# EasyEDA Pro project Orion SR SCH.epro

# Schematic Schematic1
Board Name: Board1; Create Date: 2026-11-20; Page Name: P1; Project Name: Orion G07(4); Schematic Name: Schematic1; Update Date: 2026-11-20; Company: EasyEDA.com; Page Size: A4; Version: V1.0
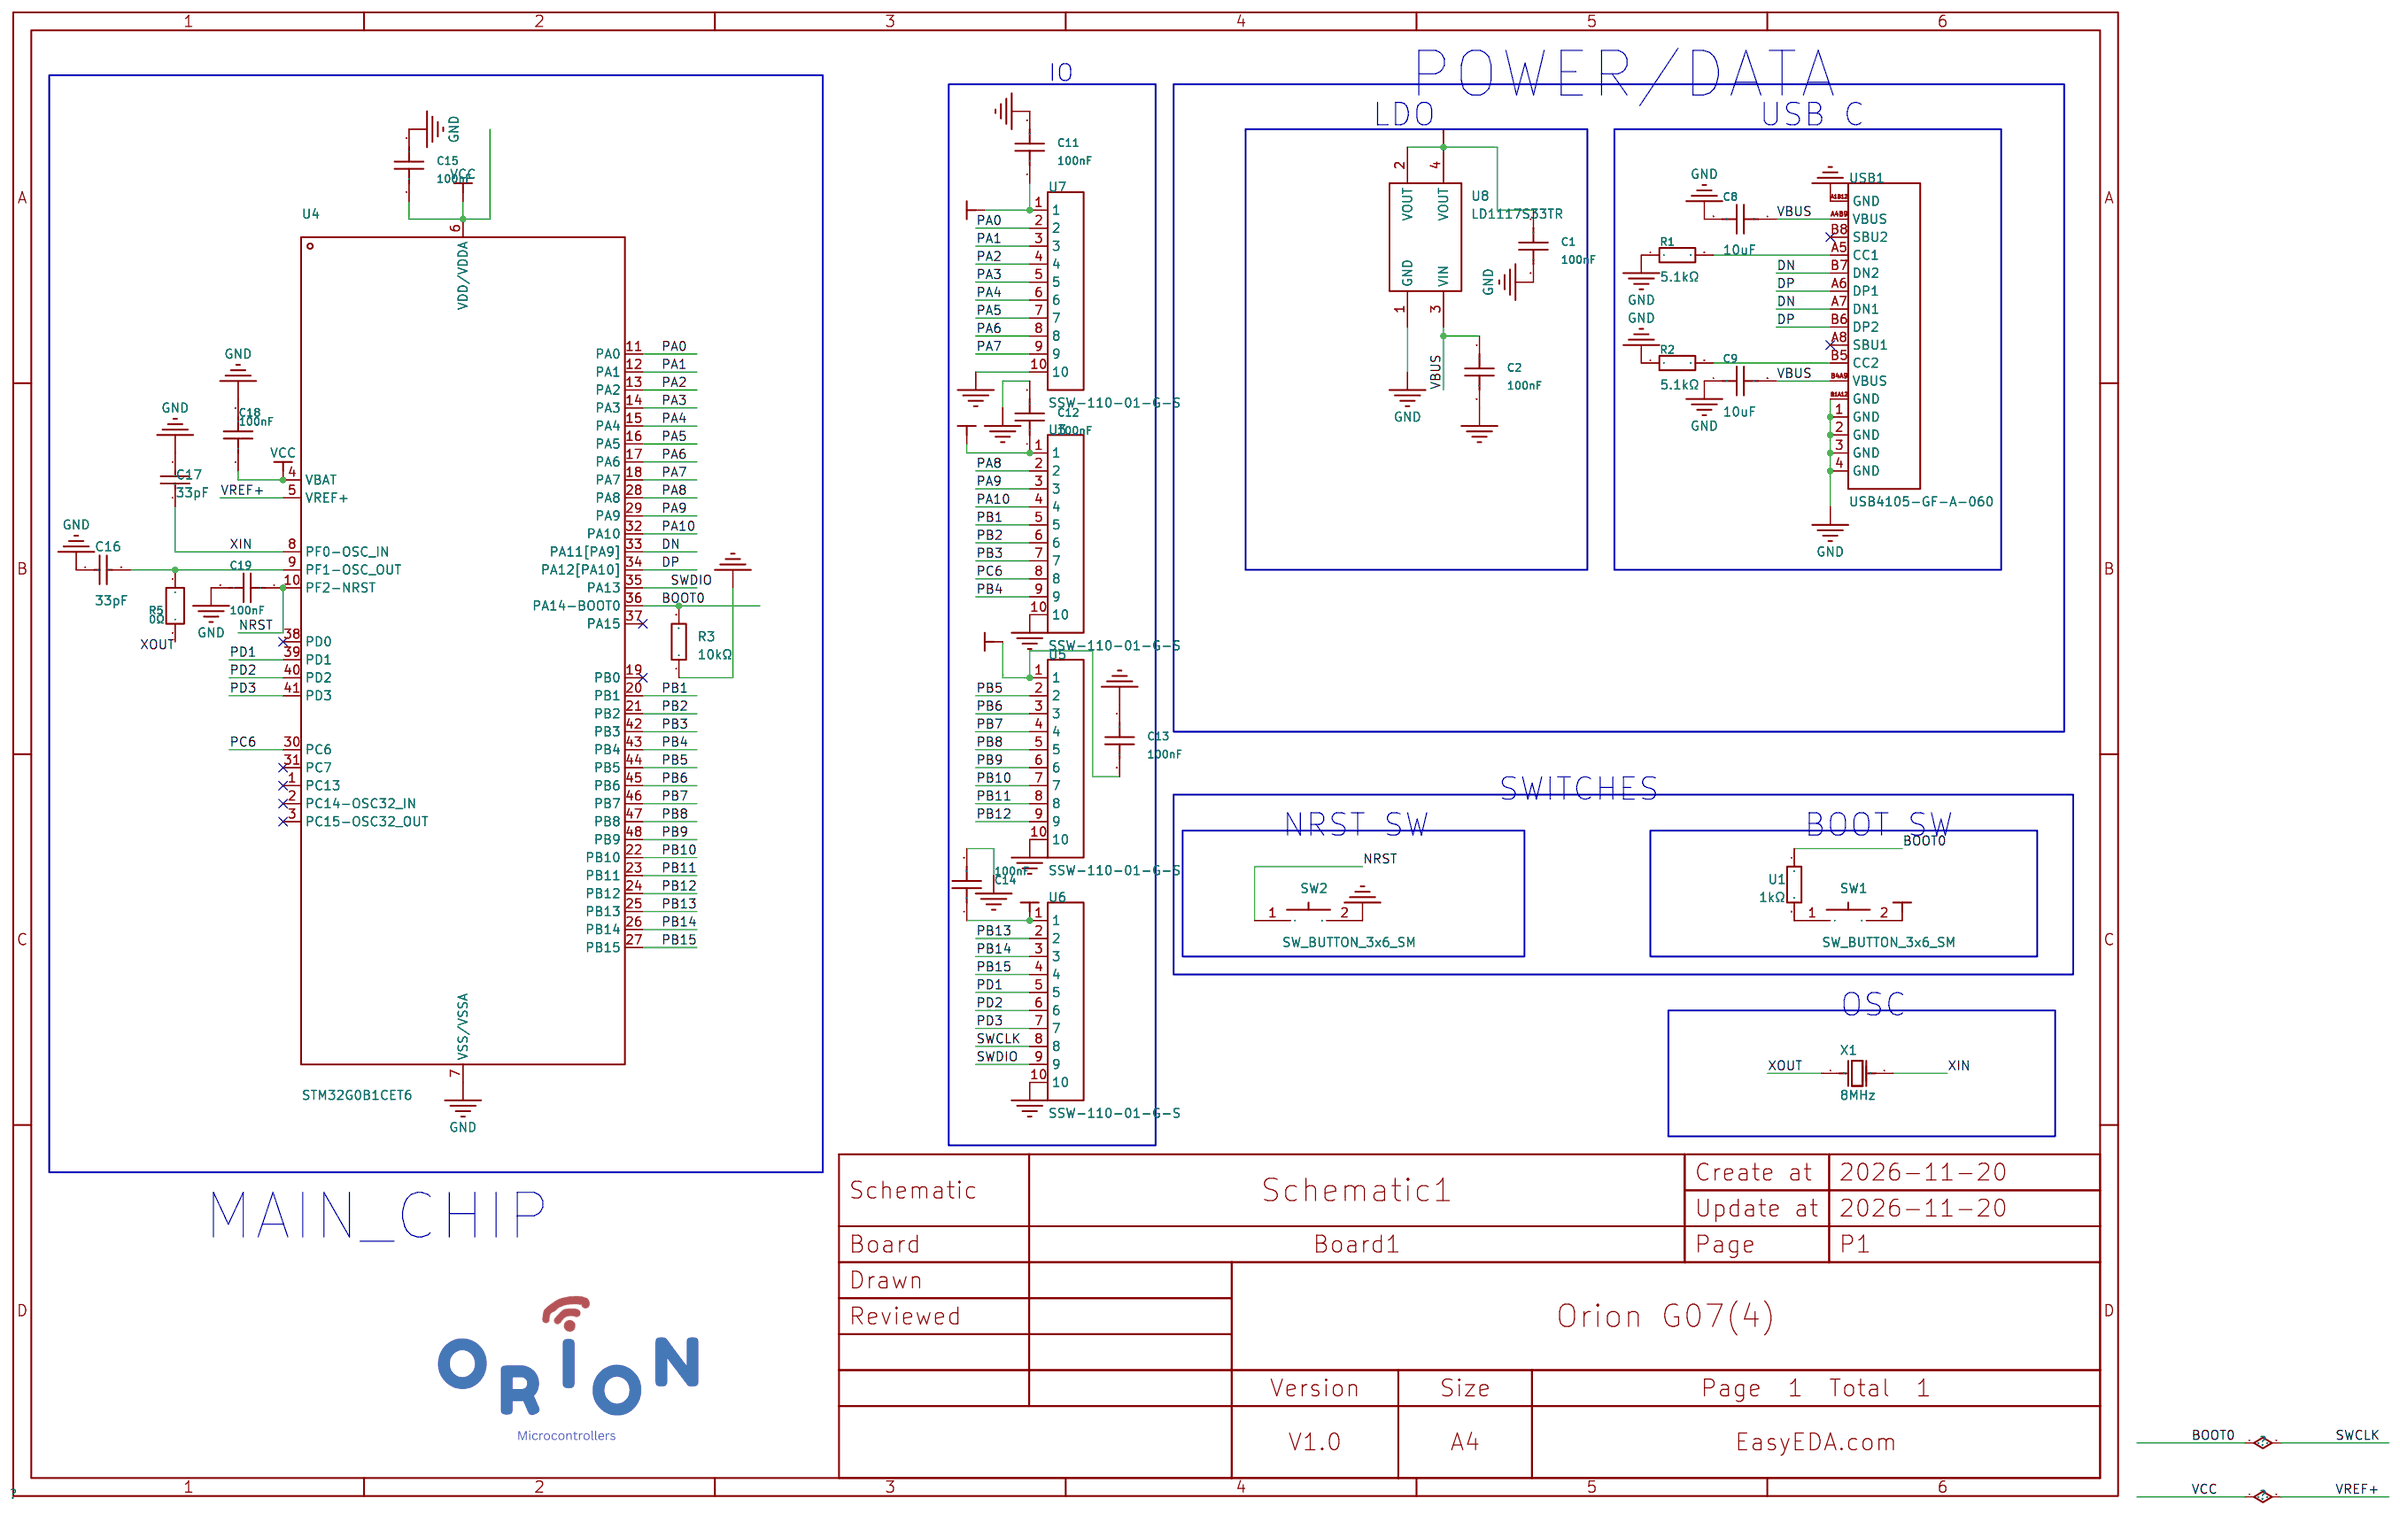
[diagram p0: schematic sheet]

## Parts
C1  100nF  [C0603]
C2  100nF  [C0603]
C8  10uF  [C0603]
C9  10uF  [C0603]
C11  100nF  [C0603]
C12  100nF  [C0603]
C13  100nF  [C0603]
C14  100nF  [C0603]
C15  100nF  [C0603]
C16  33pF  [C0402]
C17  33pF  [C0402]
C18  100nF  [C0603]
C19  100nF  [C0603]
R1  5.1kΩ  [R0402]
R2  5.1kΩ  [R0402]
R3  10kΩ  [R0201]
R5  0Ω  [R01005]
SW1  SW_BUTTON_3x6_SM  [SW-SMD_L3.9-W2.9-LS5.0]
SW2  SW_BUTTON_3x6_SM  [SW-SMD_L3.9-W2.9-LS5.0]
U1  1kΩ  [RES-SMD_L3.5-W1.5]
U3  SSW-110-01-G-S  [HDR-TH_10P-P2.54-V-F-5]
U4  STM32G0B1CET6  [LQFP-48_L7.0-W7.0-P0.50-LS9.0-BL_1]
U5  SSW-110-01-G-S  [HDR-TH_10P-P2.54-V-F-5]
U6  SSW-110-01-G-S  [HDR-TH_10P-P2.54-V-F-5]
U7  SSW-110-01-G-S  [HDR-TH_10P-P2.54-V-F-5]
U8  LD1117S33TR  [SOT-223_L6.5-W3.5-P2.30-LS7.0-BR]
USB1  USB4105-GF-A-060  [USB-C-SMD_GT-USB-7010E-1]
X1  8MHz  [CRYSTAL-SMD_L11.5-W4.8-LS12.7]

## Library data of the parts
C1 C2 C11-C15 C18 C19 = CC0603KRX7R9BB104: Capacitance:100nF Tolerance:±10% Tolerance:±10% Voltage Rating:50V Temperature Coefficient:X7R; LCSC Part Name: 100nF ±10% 50V; Supplier Part: C14663; Manufacturer: YAGEO(国巨); Supplier Footprint: 0603; JLCPCB Part Class: Basic Part; Datasheet: https://item.szlcsc.com/datasheet/CC0603KRX7R9BB104/15331.html; Supplier: LCSC; Tolerance: ±10%; Voltage Rating: 50V; Temperature Coefficient: X7R
C8 C9 = CL10A106MA8NRNC: Capacitance:10uF Tolerance:±20% Tolerance:±20% Voltage Rating:25V Temperature Coefficient:X5R; LCSC Part Name: 10uF ±20% 25V; Supplier Part: C96446; Manufacturer: SAMSUNG(三星); Supplier Footprint: 0603; JLCPCB Part Class: Basic Part; Datasheet: https://item.szlcsc.com/datasheet/CL10A106MA8NRNC/97651.html; Supplier: LCSC; Tolerance: ±20%; Voltage Rating: 25V; Temperature Coefficient: X5R
C16 C17 = 0402CG330J500NT: Capacitance:33pF Tolerance:±5% Tolerance:±5% Voltage Rating:50V Temperature Coefficient:C0G; LCSC Part Name: 33pF ±5% 50V; Supplier Part: C1562; Manufacturer: FH(风华); Supplier Footprint: 0402; JLCPCB Part Class: Basic Part; Datasheet: https://item.szlcsc.com/datasheet/0402CG330J500NT/1914.html; Supplier: LCSC; Tolerance: ±5%; Voltage Rating: 50V; Temperature Coefficient: C0G
R1 R2 = 0402WGF5101TCE: Type:Thick Film Resistor Resistance:5.1kΩ Tolerance:±1% Tolerance:±1% Power(Watts):62.5mW Voltage-Supply(Max):50V Temperature Coefficient:±100ppm/℃ Temperature Coefficient:±100ppm/℃ Operating Temperature:-55℃~+155℃ Operating Temperature:-55℃~+155℃; LCSC Part Name: 厚膜电阻 5.1kΩ ±1%; Supplier Part: C25905; Manufacturer: UNI-ROYAL(厚声); Supplier Footprint: 0402; JLCPCB Part Class: Basic Part; Datasheet: https://item.szlcsc.com/datasheet/0402WGF5101TCE/26648.html; Supplier: LCSC; Type: Thick Film Resistor; Tolerance: ±1%; Power(Watts): 62.5mW; Voltage-Supply(Max): 50V; Temperature Coefficient: ±100ppm/℃; Operating Temperature: -55℃~+155℃
R3 = AC0201FR-0710KL: Body Length:- Tolerance: Operating Temperature Range: Operating Temperature Range: φD:- Temperature Coefficient: Temperature Coefficient: Body Height:- Body Width:- Overload Voltage (Max): Type:Thick Film Resistors Resistance: Power(Watts):; LCSC Part Name: 10kΩ ±1%; Supplier Part: C144833; Manufacturer: YAGEO(国巨); Supplier Footprint: 0201; JLCPCB Part Class: Extended Part; Datasheet: https://atta.szlcsc.com/upload/public/pdf/source/20180403/C144833_FB179D8CE9F0B336E1C7C8D76C060832.pdf; Supplier: LCSC; Type: Thick Film Resistors
R5 = RTT005000JH1: Type:Thick Film Resistor Resistance:0Ω Tolerance:±5% Tolerance:±5% Power(Watts):31.25mW Voltage-Supply(Max):15V Temperature Coefficient:±250ppm/℃ Temperature Coefficient:±250ppm/℃ Operating Temperature:-55℃~+125℃ Operating Temperature:-55℃~+125℃; LCSC Part Name: 厚膜电阻 0Ω ±5% 31.25mW; Supplier Part: C304967; Manufacturer: RALEC(旺诠); Supplier Footprint: 01005; JLCPCB Part Class: Extended Part; Datasheet: https://item.szlcsc.com/datasheet/RTT005000JH1/289034.html; Supplier: LCSC; Type: Thick Film Resistor; Tolerance: ±5%; Power(Watts): 31.25mW; Voltage-Supply(Max): 15V; Temperature Coefficient: ±250ppm/℃; Operating Temperature: -55℃~+125℃
SW1 SW2 = SW_BUTTON_3x6_SM: Supplier Part: C9900004645; Supplier Footprint: SW-SMD; JLCPCB Part Class: Extended Part; Supplier: LCSC
U1 = MELF-MFR02041/4WS1KΩFT50: Resistance: Tolerance:±1% Tolerance:±1% Power(Watts):250mW; LCSC Part Name: 1kΩ ±1% 250mW; Supplier Part: C265216; Manufacturer: Thunder Component(帝谷); Supplier Footprint: MELF; JLCPCB Part Class: Extended Part; Datasheet: https://atta.szlcsc.com/upload/public/pdf/source/20181022/C265216_1371C82A211F775460FB665E44253736.pdf; Supplier: LCSC; Tolerance: ±1%; Power(Watts): 250mW
U3 U5-U7 = SSW-110-01-G-S: Holes Structure:1x10P Pitch:2.54mm Row Spacing:- Circular Hole / Square Hole:Square Hole Mounting Type:Through Hole Number of Rows:1 Number of Positions:10P Current Rating:4.7A Voltage Rating (Max):655V Holes Direction:Top Insulation Height:8.51mm Contact; LCSC Part Name: 1x10P 间距:2.54mm 直插; Supplier Part: C5930614; Manufacturer: SAMTEC; Supplier Footprint: 插件,P=2.54mm; JLCPCB Part Class: Extended Part; Datasheet: https://item.szlcsc.com/datasheet/SSW-110-01-G-S/6867967.html; Supplier: LCSC; Holes Structure: 1x10P; Pitch: 2.54mm; Circular Hole / Square Hole: Square Hole; Mounting Type: Through Hole; Number of Rows: 1; Number of Positions: 10P; Current Rating: 4.7A; Voltage Rating (Max): 655V; Holes Direction: Top; Insulation Height: 8.51mm; Contact Material: Phosphor bronze; Contact Plating: Gold; Operating Temperature: -55℃~+125℃
U4 = STM32G0B1CET6: CPU Core:ARM Cortex-M0+ CPU Maximum Speed:64MHz Core Size:32 Bit Program Storage Size:512KB Program Memory Type:FLASH RAM Size:144KB EEPROM:- Number of I/O:44 Oscillator Type:Built-in+External Voltage - Supply:1.7V~3.6V Voltage - Supply:1.7V~3.6V Operatin; LCSC Part Name: 主流Arm Cortex-M0+ 32位MCU，最高512KB闪存，144KB内存，6个USART，定时器，ADC，DAC，通信接口，1.7-3.6V; Supplier Part: C5270267; Manufacturer: ST(意法半导体); Supplier Footprint: LQFP-48(7x7); JLCPCB Part Class: Extended Part; Datasheet: https://item.szlcsc.com/datasheet/STM32G0B1CET6/5996676.html; Supplier: LCSC; CPU Core: ARM Cortex-M0+; CPU Maximum Speed: 64MHz; Core Size: 32 Bit; Program Storage Size: 512KB; Program Memory Type: FLASH; RAM Size: 144KB; Number of I/O: 44; Oscillator Type: Built-in+External; Voltage - Supply: 1.7V~3.6V; Operating Temperature: -40℃~+85℃
U8 = LD1117S33TR: Output Type: Output Polarity:Positive Number of Outputs:1 Maximum Input Voltage:15V Output Voltage:3.3V~3.3V Output Voltage:3.3V~3.3V Dropout Voltage:1.2V@(800mA) Output Current:800mA Power Supply Rejection Ratio (PRSS):75dB@(120Hz); LCSC Part Name: Vin=15V Vout=3.3V 800mA 75dB@(120Hz); Supplier Part: C86781; Manufacturer: ST(意法半导体); Supplier Footprint: SOT-223; JLCPCB Part Class: Extended Part; Datasheet: https://atta.szlcsc.com/upload/public/pdf/source/20180503/C86781_02E4840A4F9AA5E289BFDDF0ED28B865.pdf; Supplier: LCSC; Output Polarity: Positive; Number of Outputs: 1; Maximum Input Voltage: 15V; Output Voltage: 3.3V~3.3V; Dropout Voltage: 1.2V@(800mA); Output Current: 800mA; Power Supply Rejection Ratio (PRSS): 75dB@(120Hz)
USB1 = USB4105-GF-A-060: Connector Type:Type-C Protocol Standard:USB 2.0 Gender:Female Mounting Type:Surface Mount, Right Angle Number of Contacts:12P Number of Ports:1 Current Rating-Power:5A Voltage Rating:48V Detection color:Black Operating Temperature:-40℃~+85℃ Operating Temp; LCSC Part Name: Type-C 母 卧贴; Supplier Part: C3025063; Manufacturer: GCT; Supplier Footprint: SMD; JLCPCB Part Class: Extended Part; Datasheet: https://item.szlcsc.com/datasheet/USB4105-GF-A-060/3554049.html; Supplier: LCSC; Connector Type: Type-C; Protocol Standard: USB 2.0; Gender: Female; Mounting Type: Surface Mount, Right Angle; Number of Contacts: 12P; Number of Ports: 1; Current Rating-Power: 5A; Voltage Rating: 48V; Detection color: Black; Operating Temperature: -40℃~+85℃
X1 = X49SM8MSD2SC: Type:Crystal Oscillator Frequency:8MHz Normal temperature Frequency Tolerance:±20ppm Normal temperature Frequency Tolerance:±20ppm Load Capacitance:20pF Frequency Stability:±30ppm Frequency Stability:±30ppm Equivalent Series Resistance(ESR):70Ω Operating; LCSC Part Name: HC-49SMD 8MHZ 20PF ±20PPM -20~70℃（±30PPM）; Supplier Part: C12674; Manufacturer: YXC(扬兴晶振); Supplier Footprint: HC-49S-SMD; JLCPCB Part Class: Basic Part; Datasheet: https://item.szlcsc.com/datasheet/X49SM8MSD2SC/13310.html; Supplier: LCSC; Type: Crystal Oscillator; Normal temperature Frequency Tolerance: ±20ppm; Load Capacitance: 20pF; Frequency Stability: ±30ppm; Equivalent Series Resistance(ESR): 70Ω; Operating Temperature: -20℃~+70℃

## Nets
GND: C1.2 C2.2 C8.2 C9.1 C11.2 C12.2 C13.1 C14.2 C15.2 C16.1 C17.2 C18.1 C19.2 R1.1 R2.1 R3.1 SW2.2 U3.10 U4.7(VSS/VSSA) U5.10 U6.10 U7.10 U8.1(GND) USB1.1(GND) USB1.2(GND) USB1.3(GND) USB1.4(GND) USB1.A1B12(GND) USB1.B1A12(GND)
VBUS: C2.1 C8.1 C9.2 U8.3(VIN) USB1.A4B9(VBUS) USB1.B4A9(VBUS)
VCC: C1.1 C11.1 C12.1 C13.2 C14.1 C15.1 C18.2 SW1.2 U3.1 U4.4(VBAT) U4.5(VREF+) U4.6(VDD/VDDA) U5.1 U6.1 U7.1 U8.2(VOUT) U8.4(VOUT)
BOOT0: R3.2 U1.1 U4.36(PA14-BOOT0) U6.8
DN: U4.33(PA11[PA9]) USB1.A7(DN1) USB1.B7(DN2)
DP: U4.34(PA12[PA10]) USB1.A6(DP1) USB1.B6(DP2)
NRST: C19.1 SW2.1 U4.10(PF2-NRST)
PA0: U4.11(PA0) U7.2
PA1: U4.12(PA1) U7.3
PA2: U4.13(PA2) U7.4
PA3: U4.14(PA3) U7.5
PA4: U4.15(PA4) U7.6
PA5: U4.16(PA5) U7.7
PA6: U4.17(PA6) U7.8
PA7: U4.18(PA7) U7.9
PA8: U3.2 U4.28(PA8)
PA9: U3.3 U4.29(PA9)
PA10: U3.4 U4.32(PA10)
PB1: U3.5 U4.20(PB1)
PB2: U3.6 U4.21(PB2)
PB3: U3.7 U4.42(PB3)
PB4: U3.9 U4.43(PB4)
PB5: U4.44(PB5) U5.2
PB6: U4.45(PB6) U5.3
PB7: U4.46(PB7) U5.4
PB8: U4.47(PB8) U5.5
PB9: U4.48(PB9) U5.6
PB10: U4.22(PB10) U5.7
PB11: U4.23(PB11) U5.8
PB12: U4.24(PB12) U5.9
PB13: U4.25(PB13) U6.2
PB14: U4.26(PB14) U6.3
PB15: U4.27(PB15) U6.4
PC6: U3.8 U4.30(PC6)
PD1: U4.39(PD1) U6.5
PD2: U4.40(PD2) U6.6
PD3: U4.41(PD3) U6.7
SWDIO: U4.35(PA13) U6.9
XIN: C17.1 U4.8(PF0-OSC_IN) X1.1(OSC1)
XOUT: R5.2 X1.2(OSC2)
Net-(C16-2): C16.2 R5.1 U4.9(PF1-OSC_OUT)
Net-(R1-2): R1.2 USB1.A5(CC1)
Net-(R2-2): R2.2 USB1.B5(CC2)
Net-(SW1-1): SW1.1 U1.2

Not connected (* = marked no-connect by the designer): U4 1(PC13)* 2(PC14-OSC32_IN)* 3(PC15-OSC32_OUT)* 19(PB0)* 31(PC7)* 37(PA15)* 38(PD0)*; USB1 A8(SBU1)* B8(SBU2)*

## Notes on the sheet
- IO
- POWER/DATA
- LDO
- USB C
- SWITCHES
- NRST SW
- BOOT SW
- OSC
- MAIN_CHIP
